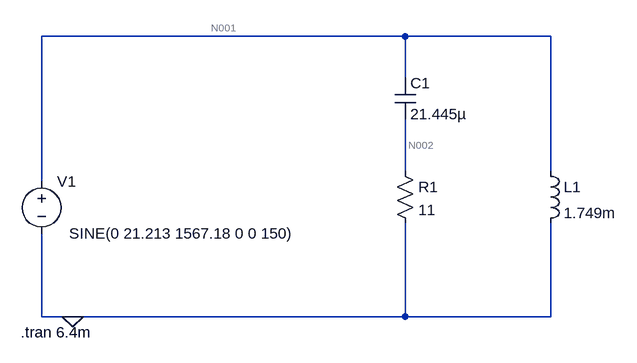
[diagram p0: schematic Draft5.asc]
Draft5.asc, the LTspice schematic file:
Version 4.1
SHEET 1 880 680
WIRE 528 -80 -32 -80
WIRE 752 -80 528 -80
WIRE 528 -16 528 -80
WIRE 528 128 528 48
WIRE 752 128 752 -80
WIRE -32 144 -32 -80
WIRE -32 352 -32 224
WIRE 16 352 -32 352
WIRE 528 352 528 208
WIRE 528 352 16 352
WIRE 752 352 752 208
WIRE 752 352 528 352
FLAG 16 352 0
SYMBOL voltage -32 128 R0
WINDOW 3 391 96 Right 2
WINDOW 123 0 0 Left 0
WINDOW 39 0 0 Left 0
SYMATTR InstName V1
SYMATTR Value SINE(0 21.213 1567.18 0 0 150)
SYMBOL res 512 112 R0
SYMATTR InstName R1
SYMATTR Value 11
SYMBOL ind 736 112 R0
SYMATTR InstName L1
SYMATTR Value 1.749m
SYMATTR SpiceLine Rser=15
SYMBOL cap 512 -16 R0
SYMATTR InstName C1
SYMATTR Value 21.445µ
TEXT -64 376 Left 2 !.tran 6.4m

The netlist it stands for:
* Draft5.asc
V1 N001 0 SINE(0 21.213 1567.18 0 0 150)
R1 N002 0 11
L1 N001 0 1.749m Rser=15
C1 N001 N002 21.445µ
.tran 6.4m
.backanno
.end

* Results of the author's LTspice run, read from the files saved beside the schematic
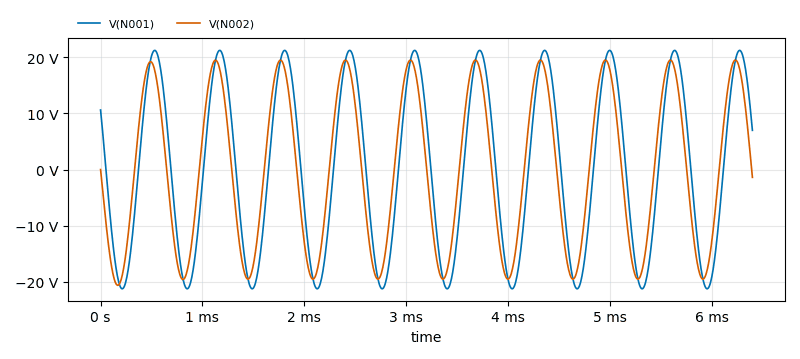
[diagram p1: Transient Analysis of Draft5.asc, plotted from the saved traces]
* Transient Analysis, 1 run:
*   V(N001): min -21.21 V, max 21.21 V, average 26.34 mV, rms 14.99 V, last 6.982 V
*   V(N002): min -20.59 V, max 19.49 V, average -82.63 mV, rms 13.8 V, last -1.382 V